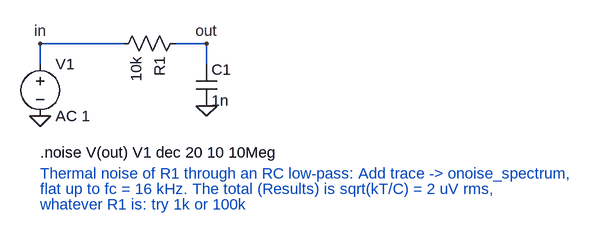
[diagram p0: schematic noise_rc.asc]
noise_rc.asc, the LTspice schematic file:
Version 4
SHEET 1 880 680
WIRE -32 96 -32 64
WIRE -32 64 96 64
WIRE 176 64 224 64
WIRE 224 64 224 96
FLAG -32 64 in
FLAG 224 64 out
FLAG -32 176 0
FLAG 224 160 0
SYMBOL voltage -32 80 R0
SYMATTR InstName V1
SYMATTR Value AC 1
SYMBOL res 192 48 R90
SYMATTR InstName R1
SYMATTR Value 10k
SYMBOL cap 208 96 R0
SYMATTR InstName C1
SYMATTR Value 1n
TEXT -32 232 Left 2 !.noise V(out) V1 dec 20 10 10Meg
TEXT -32 264 Left 2 ;Thermal noise of R1 through an RC low-pass: Add trace -> onoise_spectrum,
TEXT -32 288 Left 2 ;flat up to fc = 16 kHz. The total (Results) is sqrt(kT/C) = 2 uV rms,
TEXT -32 312 Left 2 ;whatever R1 is: try 1k or 100k

The netlist it stands for:
* noise_rc.asc
V1 in 0 AC 1
R1 out in 10k
C1 out 0 1n
.noise V(out) V1 dec 20 10 10Meg
* Thermal noise of R1 through an RC low-pass: Add trace -> onoise_spectrum,
* flat up to fc = 16 kHz. The total (Results) is sqrt(kT/C) = 2 uV rms,
* whatever R1 is: try 1k or 100k
.backanno
.end